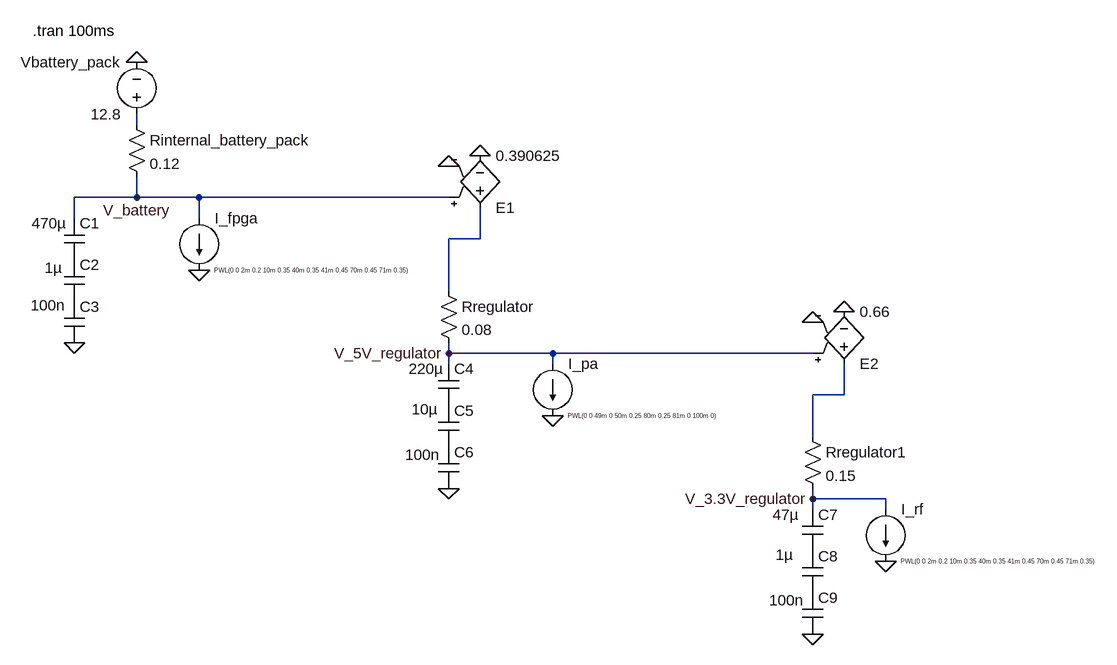
[diagram p0: schematic Battery Pack Simulation.asc]
Battery Pack Simulation.asc, the LTspice schematic file:
Version 4.1
SHEET 1 1716 900
WIRE 192 96 192 80
WIRE 192 208 192 176
WIRE 192 208 96 208
WIRE 288 208 192 208
WIRE 672 208 288 208
WIRE 96 240 96 208
WIRE 288 240 288 208
WIRE 720 272 720 224
WIRE 720 272 672 272
WIRE 672 352 672 272
WIRE 672 448 672 432
WIRE 832 448 672 448
WIRE 1232 448 832 448
WIRE 672 464 672 448
WIRE 832 464 832 448
WIRE 1280 512 1280 464
WIRE 1280 512 1232 512
WIRE 1232 576 1232 512
WIRE 1232 672 1232 656
WIRE 1344 672 1232 672
WIRE 1232 688 1232 672
WIRE 1344 688 1344 672
FLAG 192 0 0
FLAG 288 320 0
FLAG 672 448 V_5V_regulator
FLAG 96 432 0
FLAG 672 656 0
FLAG 1344 768 0
FLAG 1232 672 V_3.3V_regulator
FLAG 1232 880 0
FLAG 192 208 V_battery
FLAG 832 544 0
FLAG 672 160 0
FLAG 720 144 0
FLAG 1232 400 0
FLAG 1280 384 0
SYMBOL voltage 192 96 R180
WINDOW 0 24 96 Left 2
WINDOW 3 24 16 Left 2
WINDOW 123 0 0 Left 0
WINDOW 39 0 0 Left 0
SYMATTR InstName Vbattery_pack
SYMATTR Value 12.8
SYMBOL res 176 80 R0
SYMATTR InstName Rinternal_battery_pack
SYMATTR Value 0.12
SYMBOL cap 80 240 R0
WINDOW 3 -50 8 Left 2
SYMATTR Value 470µ
SYMATTR InstName C1
SYMBOL cap 80 304 R0
WINDOW 3 -30 12 Left 2
SYMATTR Value 1µ
SYMATTR InstName C2
SYMBOL cap 80 368 R0
WINDOW 3 -51 6 Left 2
SYMATTR Value 100n
SYMATTR InstName C3
SYMBOL current 288 240 R0
WINDOW 3 23 80 Left 0
WINDOW 123 0 0 Left 0
WINDOW 39 0 0 Left 0
SYMATTR Value PWL(0 0 2m 0.2 10m 0.35 40m 0.35 41m 0.45 70m 0.45 71m 0.35)
SYMATTR InstName I_fpga
SYMBOL res 656 336 R0
SYMATTR InstName Rregulator
SYMATTR Value 0.08
SYMBOL cap 656 464 R0
WINDOW 3 -46 8 Left 2
SYMATTR Value 220µ
SYMATTR InstName C4
SYMBOL cap 656 528 R0
WINDOW 3 -41 6 Left 2
SYMATTR Value 10µ
SYMATTR InstName C5
SYMBOL cap 656 592 R0
WINDOW 3 -51 12 Left 2
SYMATTR Value 100n
SYMATTR InstName C6
SYMBOL current 1344 688 R0
WINDOW 3 23 80 Left 0
WINDOW 123 0 0 Left 0
WINDOW 39 0 0 Left 0
SYMATTR Value PWL(0 0 2m 0.2 10m 0.35 40m 0.35 41m 0.45 70m 0.45 71m 0.35)
SYMATTR InstName I_rf
SYMBOL res 1216 560 R0
SYMATTR InstName Rregulator1
SYMATTR Value 0.15
SYMBOL cap 1216 688 R0
WINDOW 3 -46 8 Left 2
SYMATTR Value 47µ
SYMATTR InstName C7
SYMBOL cap 1216 752 R0
WINDOW 3 -41 6 Left 2
SYMATTR Value 1µ
SYMATTR InstName C8
SYMBOL cap 1216 816 R0
WINDOW 3 -51 12 Left 2
SYMATTR Value 100n
SYMATTR InstName C9
SYMBOL current 832 464 R0
WINDOW 3 23 80 Left 0
WINDOW 123 0 0 Left 0
WINDOW 39 0 0 Left 0
SYMATTR Value PWL(0 0 49m 0 50m 0.25 80m 0.25 81m 0 100m 0)
SYMATTR InstName I_pa
SYMBOL e 720 240 M180
SYMATTR InstName E1
SYMATTR Value 0.390625
SYMBOL e 1280 480 M180
SYMATTR InstName E2
SYMATTR Value 0.66
TEXT 32 -48 Left 2 !.tran 100ms

The netlist it stands for:
* Battery Pack Simulation.asc
Vbattery_pack N001 0 12.8
Rinternal_battery_pack N001 V_battery 0.12
C1 V_battery P001 470µ
C2 P001 P002 1µ
C3 P002 0 100n
I_fpga V_battery 0 PWL(0 0 2m 0.2 10m 0.35 40m 0.35 41m 0.45 70m 0.45 71m 0.35)
Rregulator N002 V_5V_regulator 0.08
C4 V_5V_regulator P003 220µ
C5 P003 P004 10µ
C6 P004 0 100n
I_rf V_3.3V_regulator 0 PWL(0 0 2m 0.2 10m 0.35 40m 0.35 41m 0.45 70m 0.45 71m 0.35)
Rregulator1 N003 V_3.3V_regulator 0.15
C7 V_3.3V_regulator P005 47µ
C8 P005 P006 1µ
C9 P006 0 100n
I_pa V_5V_regulator 0 PWL(0 0 49m 0 50m 0.25 80m 0.25 81m 0 100m 0)
E1 N002 0 V_battery 0 0.390625
E2 N003 0 V_5V_regulator 0 0.66
.tran 100ms
.backanno
.end

* Results of the author's LTspice run, read from the files saved beside the schematic
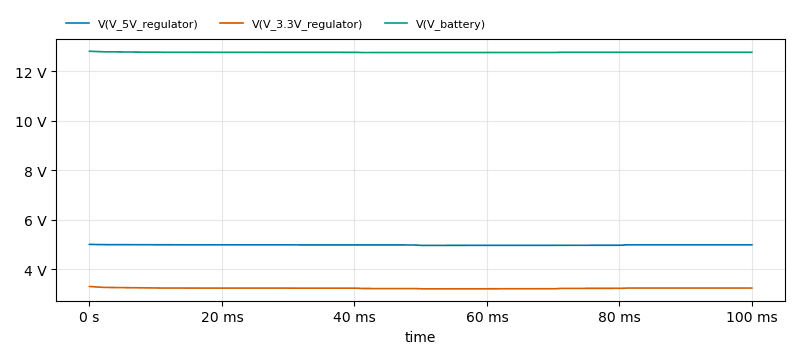
[diagram p1: Transient Analysis of Battery Pack Simulation.asc, plotted from the saved traces]
* Transient Analysis, 1 run:
*   V(V_5V_regulator): min 4.959 V, max 5 V, average 4.977 V, rms 4.977 V, last 4.984 V
*   V(V_3.3V_regulator): min 3.205 V, max 3.3 V, average 3.229 V, rms 3.229 V, last 3.237 V
*   V(V_battery): min 12.75 V, max 12.8 V, average 12.76 V, rms 12.76 V, last 12.76 V